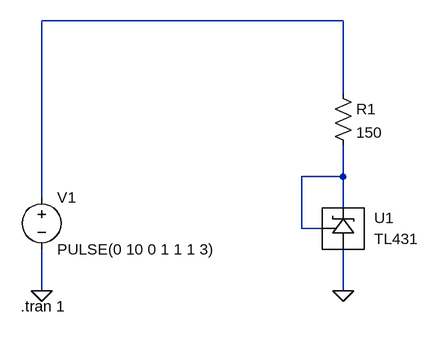
[diagram p0: schematic test_tl431.asc]
test_tl431.asc, the LTspice schematic file:
Version 4.1
SHEET 1 880 680
WIRE 208 -16 -256 -16
WIRE 208 96 208 -16
WIRE 208 224 208 176
WIRE 208 224 144 224
WIRE -256 256 -256 -16
WIRE 208 272 208 224
WIRE 144 304 144 224
WIRE 176 304 144 304
WIRE -256 400 -256 336
WIRE 208 400 208 336
FLAG -256 400 0
FLAG 208 400 0
SYMBOL res 192 80 R0
SYMATTR InstName R1
SYMATTR Value 150
SYMBOL voltage -256 240 R0
WINDOW 123 0 0 Left 0
WINDOW 39 0 0 Left 0
SYMATTR InstName V1
SYMATTR Value PULSE(0 10 0 1 1 1 3)
SYMBOL VoltageReference\\TL431 208 304 R0
SYMATTR InstName U1
TEXT -288 424 Left 2 !.tran 1

The netlist it stands for:
* test_tl431.asc
R1 N001 N002 150
V1 N001 0 PULSE(0 10 0 1 1 1 3)
X§U1 0 N002 N002 TL431  ; pins ANODE CATODE ADJ
.tran 1
.lib VoltageReference/tl431.lib
.backanno
.end